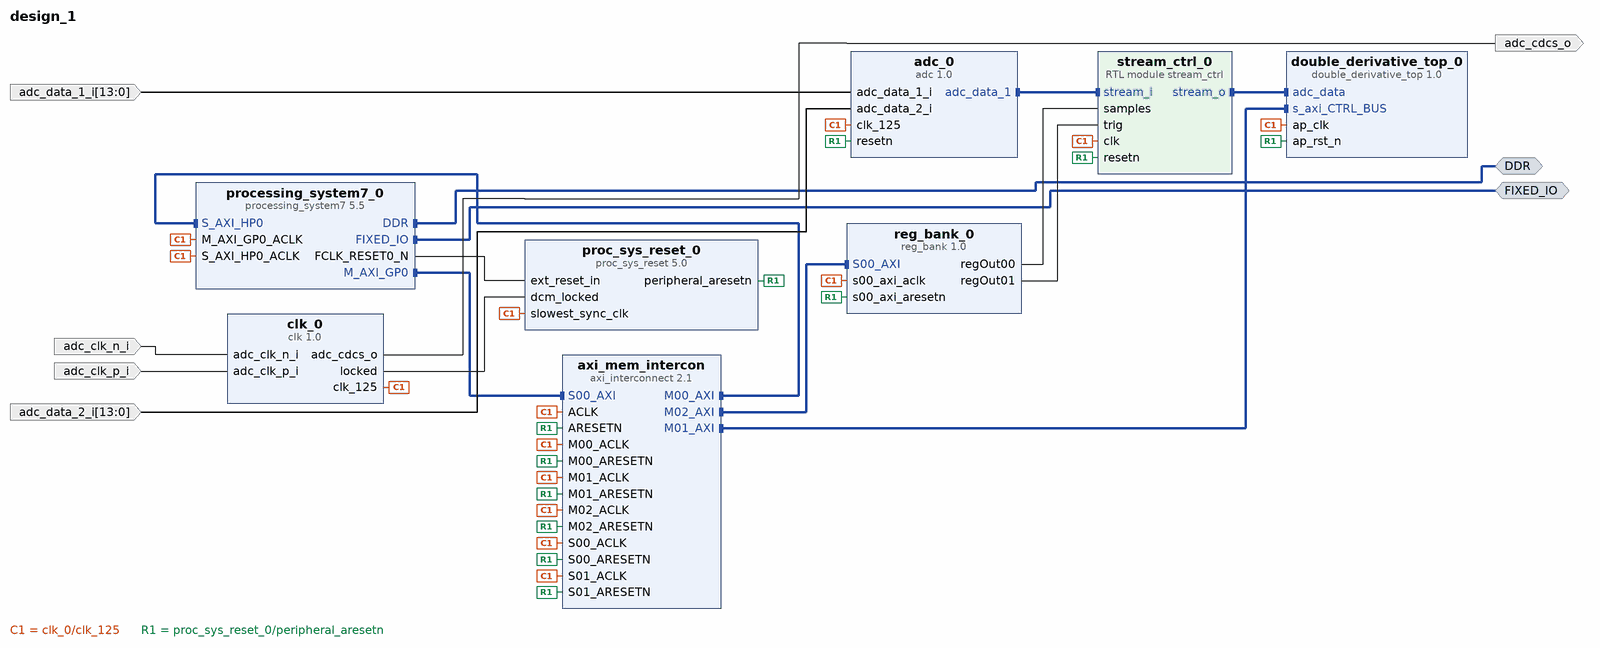
[diagram p0: block diagram of the top level]
# Vivado block design design_1, xc7z020clg400-1, Vivado 2025.2
create_bd_design design_1

create_bd_intf_port -mode Master -vlnv xilinx.com:interface:ddrx_rtl:1.0 DDR
create_bd_intf_port -mode Master -vlnv xilinx.com:display_processing_system7:fixedio_rtl:1.0 FIXED_IO
create_bd_port -dir I -from 13 -to 0 adc_data_1_i
create_bd_port -dir I -from 13 -to 0 adc_data_2_i
create_bd_port -dir I adc_clk_n_i
create_bd_port -dir I adc_clk_p_i
create_bd_port -dir O adc_cdcs_o

create_bd_cell -type ip -vlnv xilinx.com:ip:processing_system7:5.5 processing_system7_0
set_property -dict {CONFIG.PCW_PERIPHERAL_BOARD_PRESET None CONFIG.PCW_USE_S_AXI_HP0 1} [get_bd_cells processing_system7_0]
# 1 more settings of processing_system7_0 are not shown: defaults, MIO pin electricals, DDR timing, and values the tool derives
create_bd_cell -type ip -vlnv DSPsandbox:FPGA-Notes-for-Scientists:adc:1.0 adc_0
create_bd_cell -type ip -vlnv xilinx.com:ip:proc_sys_reset:5.0 proc_sys_reset_0
create_bd_cell -type module -reference stream_ctrl stream_ctrl_0
create_bd_cell -type ip -vlnv xilinx.com:ip:axi_interconnect:2.1 axi_mem_intercon
set_property -dict {CONFIG.NUM_MI 3 CONFIG.NUM_SI 2} [get_bd_cells axi_mem_intercon]
create_bd_cell -type ip -vlnv DSPsandbox:FPGA-Notes-for-Scientists:clk:1.0 clk_0
create_bd_cell -type ip -vlnv DSPsandbox:FPGA-Notes-for-Scientists:reg_bank:1.0 reg_bank_0
set_property -dict {CONFIG.port_width_reg_out_01 1 CONFIG.reg_in_enabled 0 CONFIG.reg_out_enabled 2} [get_bd_cells reg_bank_0]
create_bd_cell -type ip -vlnv xilinx.com:hls:double_derivative_top:1.0 double_derivative_top_0

# ---- connections ----

connect_bd_intf_net [get_bd_intf_pins adc_0/adc_data_1] [get_bd_intf_pins stream_ctrl_0/stream_i]
connect_bd_intf_net [get_bd_intf_pins axi_mem_intercon/M00_AXI] [get_bd_intf_pins processing_system7_0/S_AXI_HP0]
connect_bd_intf_net [get_bd_intf_pins axi_mem_intercon/M01_AXI] [get_bd_intf_pins double_derivative_top_0/s_axi_CTRL_BUS]
connect_bd_intf_net [get_bd_intf_pins axi_mem_intercon/M02_AXI] [get_bd_intf_pins reg_bank_0/S00_AXI]
connect_bd_intf_net [get_bd_intf_ports DDR] [get_bd_intf_pins processing_system7_0/DDR]
connect_bd_intf_net [get_bd_intf_ports FIXED_IO] [get_bd_intf_pins processing_system7_0/FIXED_IO]
connect_bd_intf_net [get_bd_intf_pins processing_system7_0/M_AXI_GP0] [get_bd_intf_pins axi_mem_intercon/S00_AXI]
connect_bd_intf_net [get_bd_intf_pins stream_ctrl_0/stream_o] [get_bd_intf_pins double_derivative_top_0/adc_data]
connect_bd_net [get_bd_ports adc_clk_n_i] [get_bd_pins clk_0/adc_clk_n_i]
connect_bd_net [get_bd_ports adc_clk_p_i] [get_bd_pins clk_0/adc_clk_p_i]
connect_bd_net [get_bd_ports adc_data_1_i] [get_bd_pins adc_0/adc_data_1_i]
connect_bd_net [get_bd_ports adc_data_2_i] [get_bd_pins adc_0/adc_data_2_i]
connect_bd_net [get_bd_pins clk_0/adc_cdcs_o] [get_bd_ports adc_cdcs_o]
connect_bd_net [get_bd_pins clk_0/clk_125] \
  [get_bd_pins stream_ctrl_0/clk] [get_bd_pins axi_mem_intercon/ACLK] [get_bd_pins axi_mem_intercon/S00_ACLK] \
  [get_bd_pins axi_mem_intercon/M00_ACLK] [get_bd_pins axi_mem_intercon/S01_ACLK] [get_bd_pins adc_0/clk_125] \
  [get_bd_pins reg_bank_0/s00_axi_aclk] [get_bd_pins axi_mem_intercon/M01_ACLK] [get_bd_pins axi_mem_intercon/M02_ACLK] \
  [get_bd_pins proc_sys_reset_0/slowest_sync_clk] [get_bd_pins processing_system7_0/M_AXI_GP0_ACLK] \
  [get_bd_pins processing_system7_0/S_AXI_HP0_ACLK] [get_bd_pins double_derivative_top_0/ap_clk]
connect_bd_net [get_bd_pins clk_0/locked] [get_bd_pins proc_sys_reset_0/dcm_locked]
connect_bd_net [get_bd_pins proc_sys_reset_0/peripheral_aresetn] \
  [get_bd_pins stream_ctrl_0/resetn] [get_bd_pins axi_mem_intercon/S00_ARESETN] [get_bd_pins axi_mem_intercon/M00_ARESETN] \
  [get_bd_pins axi_mem_intercon/ARESETN] [get_bd_pins axi_mem_intercon/S01_ARESETN] [get_bd_pins adc_0/resetn] \
  [get_bd_pins reg_bank_0/s00_axi_aresetn] [get_bd_pins axi_mem_intercon/M01_ARESETN] \
  [get_bd_pins axi_mem_intercon/M02_ARESETN] [get_bd_pins double_derivative_top_0/ap_rst_n]
connect_bd_net [get_bd_pins processing_system7_0/FCLK_RESET0_N] [get_bd_pins proc_sys_reset_0/ext_reset_in]
connect_bd_net [get_bd_pins reg_bank_0/regOut00] [get_bd_pins stream_ctrl_0/samples]
connect_bd_net [get_bd_pins reg_bank_0/regOut01] [get_bd_pins stream_ctrl_0/trig]

# ---- address map ----
assign_bd_address -offset 0x40000000 -range 64K -target_address_space [get_bd_addr_spaces processing_system7_0/Data] [get_bd_addr_segs double_derivative_top_0/s_axi_CTRL_BUS/Reg]
assign_bd_address -offset 0x43C00000 -range 64K -target_address_space [get_bd_addr_spaces processing_system7_0/Data] [get_bd_addr_segs reg_bank_0/S00_AXI/S00_AXI_reg]

validate_bd_design
save_bd_design
